# Altium schematic sheet TestPoint-Sheet.SchDoc
size A4; SheetNumber: 10; SheetTotal: 10
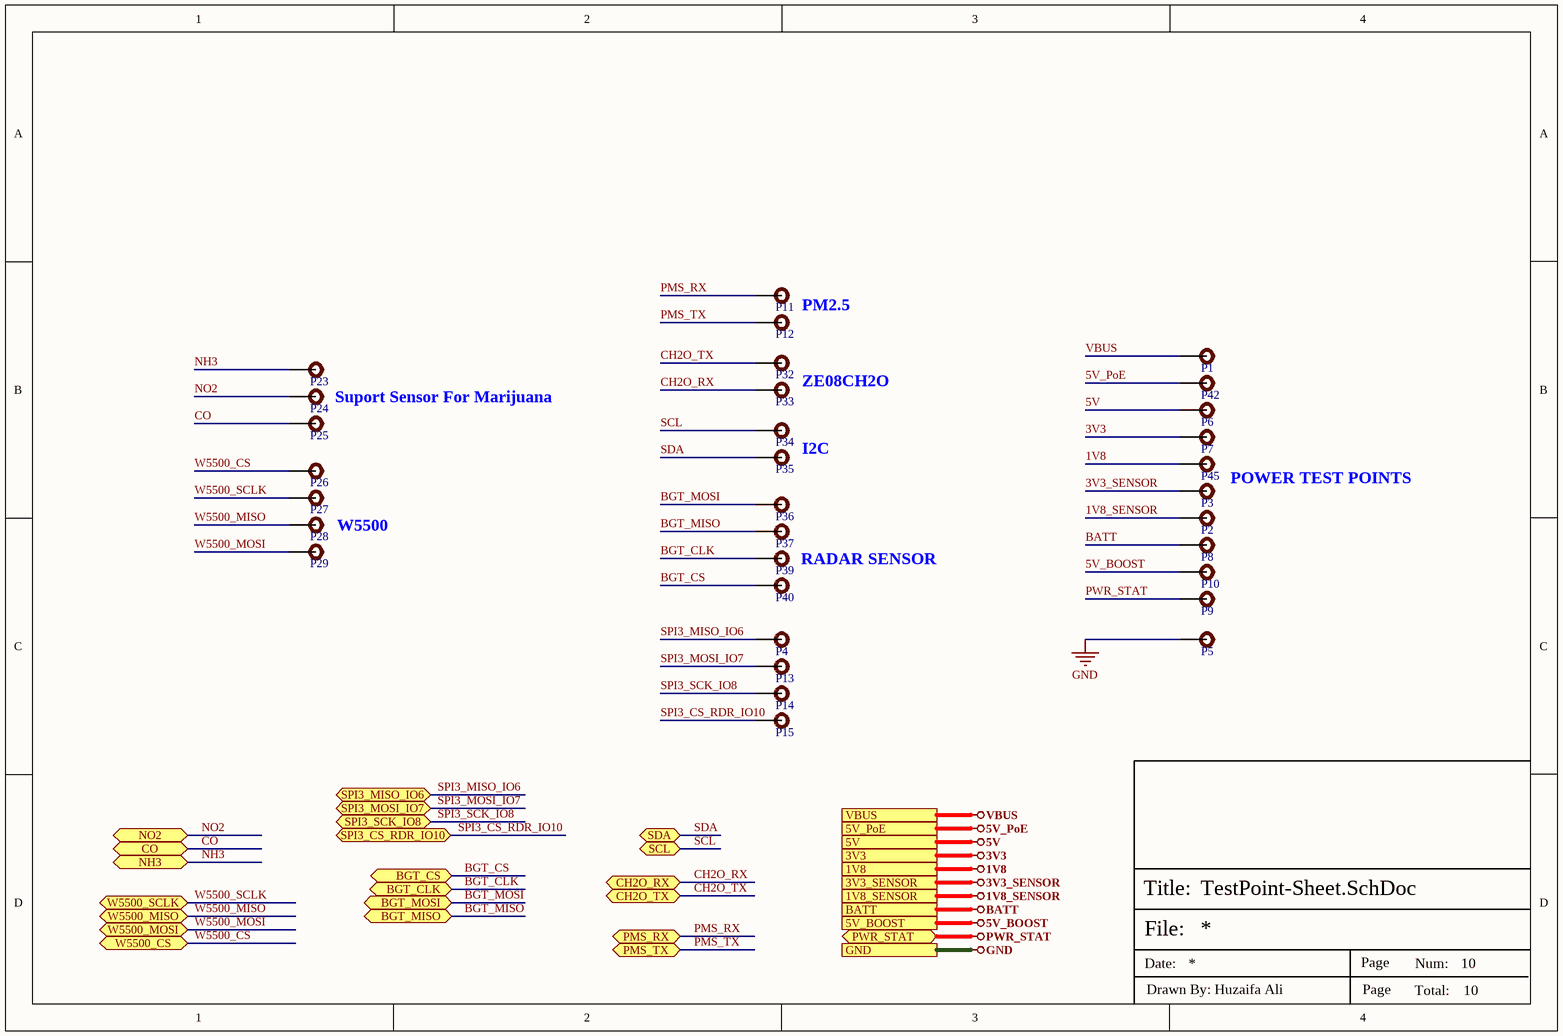
[diagram p0: TestPoint-Sheet.SchDoc]

## Parts
P1  TEST POINT  [Test-point]  (value not drawn)  (no BOM)
P2  TEST POINT  [Test-point]  (value not drawn)  (no BOM)
P3  TEST POINT  [Test-point]  (value not drawn)  (no BOM)
P4  TEST POINT  [Test-point]  (value not drawn)
P5  TEST POINT  [Test-point]  (value not drawn)
P6  TEST POINT  [Test-point]  (value not drawn)  (no BOM)
P7  TEST POINT  [Test-point]  (value not drawn)  (no BOM)
P8  TEST POINT  [Test-point]  (value not drawn)
P9  TEST POINT  [Test-point]  (value not drawn)
P10  TEST POINT  [Test-point]  (value not drawn)
P11  TEST POINT  [Test-point]  (value not drawn)
P12  TEST POINT  [Test-point]  (value not drawn)
P13  TEST POINT  [Test-point]  (value not drawn)
P14  TEST POINT  [Test-point]  (value not drawn)
P15  TEST POINT  [Test-point]  (value not drawn)
P23  TEST POINT  [Test-point]  (value not drawn)  (no BOM)
P24  TEST POINT  [Test-point]  (value not drawn)  (no BOM)
P25  TEST POINT  [Test-point]  (value not drawn)  (no BOM)
P26  TEST POINT  [Test-point]  (value not drawn)  (no BOM)
P27  TEST POINT  [Test-point]  (value not drawn)  (no BOM)
P28  TEST POINT  [Test-point]  (value not drawn)  (no BOM)
P29  TEST POINT  [Test-point]  (value not drawn)  (no BOM)
P32  TEST POINT  [Test-point]  (value not drawn)  (no BOM)
P33  TEST POINT  [Test-point]  (value not drawn)  (no BOM)
P34  TEST POINT  [Test-point]  (value not drawn)  (no BOM)
P35  TEST POINT  [Test-point]  (value not drawn)  (no BOM)
P36  TEST POINT  [Test-point]  (value not drawn)  (no BOM)
P37  TEST POINT  [Test-point]  (value not drawn)  (no BOM)
P39  TEST POINT  [Test-point]  (value not drawn)  (no BOM)
P40  TEST POINT  [Test-point]  (value not drawn)  (no BOM)
P42  TEST POINT  [Test-point]  (value not drawn)  (no BOM)
P45  TEST POINT  [Test-point]  (value not drawn)  (no BOM)

## Ports
1V8, 1V8_SENSOR, 3V3, 3V3_SENSOR, 5V, 5V_BOOST, 5V_PoE, BATT, BGT_CLK (bidir), BGT_CS (bidir), BGT_MISO (bidir), BGT_MOSI (bidir), CH2O_RX (bidir), CH2O_TX (bidir), CO (bidir), GND, NH3 (bidir), NO2 (bidir), PMS_RX (bidir), PMS_TX (bidir), PWR_STAT (bidir), SCL (bidir), SDA (bidir), SPI3_CS_RDR_IO10 (bidir), SPI3_MISO_IO6 (bidir), SPI3_MOSI_IO7 (bidir), SPI3_SCK_IO8 (bidir), VBUS, W5500_CS (bidir), W5500_MISO (bidir), W5500_MOSI (bidir), W5500_SCLK (bidir)

## Nets
1V8: P45.1 ; port 1V8
1V8_SENSOR: P2.1 ; port 1V8_SENSOR
3V3: P7.1 ; port 3V3
3V3_SENSOR: P3.1 ; port 3V3_SENSOR
5V: P6.1 ; port 5V
5V_BOOST: P10.1 ; port 5V_BOOST
5V_PoE: P42.1 ; port 5V_PoE
BATT: P8.1 ; port BATT
GND: P5.1 ; port GND
PWR_STAT: P9.1 ; port PWR_STAT
VBUS: P1.1 ; port VBUS
BGT_CLK: P39.1 ; port BGT_CLK
BGT_CS: P40.1 ; port BGT_CS
BGT_MISO: P37.1 ; port BGT_MISO
BGT_MOSI: P36.1 ; port BGT_MOSI
CH2O_RX: P33.1 ; port CH2O_RX
CH2O_TX: P32.1 ; port CH2O_TX
CO: P25.1 ; port CO
NH3: P23.1 ; port NH3
NO2: P24.1 ; port NO2
PMS_RX: P11.1 ; port PMS_RX
PMS_TX: P12.1 ; port PMS_TX
SCL: P34.1 ; port SCL
SDA: P35.1 ; port SDA
SPI3_CS_RDR_IO10: P15.1 ; port SPI3_CS_RDR_IO10
SPI3_MISO_IO6: P4.1 ; port SPI3_MISO_IO6
SPI3_MOSI_IO7: P13.1 ; port SPI3_MOSI_IO7
SPI3_SCK_IO8: P14.1 ; port SPI3_SCK_IO8
W5500_CS: P26.1 ; port W5500_CS
W5500_MISO: P28.1 ; port W5500_MISO
W5500_MOSI: P29.1 ; port W5500_MOSI
W5500_SCLK: P27.1 ; port W5500_SCLK

## Notes on the sheet
- PM2.5
- ZE08CH2O
- Suport Sensor For Marijuana
- W5500
- I2C
- POWER TEST POINTS
- RADAR SENSOR
- File:
- Title:
- Date:
- Page
- Num:
- Total:
- Drawn By: Huzaifa Ali

## Library data of the parts
P1-P15 P23-P29 P32-P37 P39 P40 P42 P45 = TEST POINT: Test Point ON; Item Type: TEST POINT